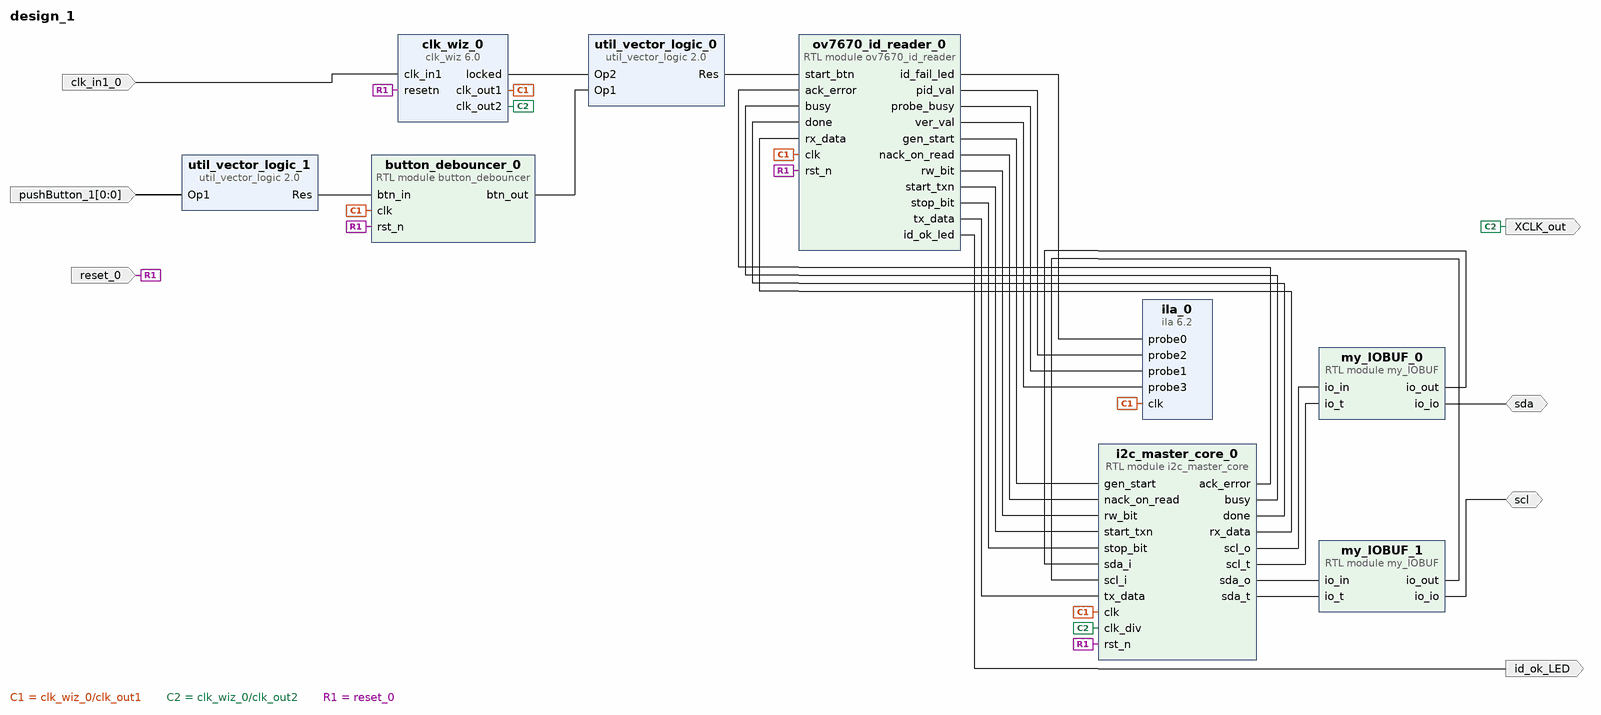
[diagram p0: block diagram of the top level]
# Vivado block design design_1, xc7z020clg400-2, Vivado 2022.2
create_bd_design design_1

create_bd_port -dir I -type rst reset_0
set_property -dict {CONFIG.POLARITY ACTIVE_LOW} [get_bd_ports reset_0]
create_bd_port -dir O -type clk XCLK_out
create_bd_port -dir IO sda
create_bd_port -dir IO scl
create_bd_port -dir I -from 0 -to 0 pushButton_1
create_bd_port -dir O id_ok_LED
create_bd_port -dir I -type clk clk_in1_0
set_property -dict {CONFIG.FREQ_HZ 50000000} [get_bd_ports clk_in1_0]

create_bd_cell -type ip -vlnv xilinx.com:ip:clk_wiz:6.0 clk_wiz_0
set_property -dict [list \
  CONFIG.CLKIN1_JITTER_PS 200.0 \
  CONFIG.CLKOUT1_JITTER 139.128 \
  CONFIG.CLKOUT1_PHASE_ERROR 154.678 \
  CONFIG.CLKOUT2_JITTER 202.151 \
  CONFIG.CLKOUT2_PHASE_ERROR 154.678 \
  CONFIG.CLKOUT2_REQUESTED_OUT_FREQ 24 \
  CONFIG.CLKOUT2_USED true \
  CONFIG.MMCM_CLKFBOUT_MULT_F 24.000 \
  CONFIG.MMCM_CLKIN1_PERIOD 20.000 \
  CONFIG.MMCM_CLKIN2_PERIOD 10.0 \
  CONFIG.MMCM_CLKOUT0_DIVIDE_F 12.000 \
  CONFIG.MMCM_CLKOUT1_DIVIDE 50 \
  CONFIG.NUM_OUT_CLKS 2 \
  CONFIG.PRIM_IN_FREQ 50.0 \
  CONFIG.RESET_PORT resetn \
  CONFIG.RESET_TYPE ACTIVE_LOW \
] [get_bd_cells clk_wiz_0]
create_bd_cell -type ip -vlnv xilinx.com:ip:util_vector_logic:2.0 util_vector_logic_0
create_bd_cell -type ip -vlnv xilinx.com:ip:util_vector_logic:2.0 util_vector_logic_1
set_property -dict {CONFIG.C_OPERATION not CONFIG.C_SIZE 1} [get_bd_cells util_vector_logic_1]
create_bd_cell -type ip -vlnv xilinx.com:ip:ila:6.2 ila_0
set_property -dict [list \
  CONFIG.C_DATA_DEPTH 65536 \
  CONFIG.C_MONITOR_TYPE Native \
  CONFIG.C_NUM_OF_PROBES 4 \
  CONFIG.C_PROBE0_TYPE 0 \
  CONFIG.C_PROBE2_WIDTH 8 \
  CONFIG.C_PROBE3_WIDTH 8 \
] [get_bd_cells ila_0]
create_bd_cell -type module -reference button_debouncer button_debouncer_0
create_bd_cell -type module -reference my_IOBUF my_IOBUF_0
create_bd_cell -type module -reference my_IOBUF my_IOBUF_1
create_bd_cell -type module -reference i2c_master_core i2c_master_core_0
create_bd_cell -type module -reference ov7670_id_reader ov7670_id_reader_0

# ---- connections ----

connect_bd_net [get_bd_ports sda] [get_bd_pins my_IOBUF_0/io_io]
connect_bd_net [get_bd_ports scl] [get_bd_pins my_IOBUF_1/io_io]
connect_bd_net -net Op1_0_1 [get_bd_ports pushButton_1] [get_bd_pins util_vector_logic_1/Op1]
connect_bd_net [get_bd_pins button_debouncer_0/btn_out] [get_bd_pins util_vector_logic_0/Op1]
connect_bd_net -net clk_in1_0_1 [get_bd_ports clk_in1_0] [get_bd_pins clk_wiz_0/clk_in1]
connect_bd_net [get_bd_pins clk_wiz_0/clk_out1] \
  [get_bd_pins button_debouncer_0/clk] [get_bd_pins ila_0/clk] [get_bd_pins i2c_master_core_0/clk] \
  [get_bd_pins ov7670_id_reader_0/clk]
connect_bd_net [get_bd_pins clk_wiz_0/clk_out2] [get_bd_ports XCLK_out] [get_bd_pins i2c_master_core_0/clk_div]
connect_bd_net [get_bd_pins clk_wiz_0/locked] [get_bd_pins util_vector_logic_0/Op2]
connect_bd_net [get_bd_pins i2c_master_core_0/ack_error] [get_bd_pins ov7670_id_reader_0/ack_error]
connect_bd_net [get_bd_pins i2c_master_core_0/busy] [get_bd_pins ov7670_id_reader_0/busy]
connect_bd_net [get_bd_pins i2c_master_core_0/done] [get_bd_pins ov7670_id_reader_0/done]
connect_bd_net [get_bd_pins i2c_master_core_0/rx_data] [get_bd_pins ov7670_id_reader_0/rx_data]
connect_bd_net [get_bd_pins i2c_master_core_0/scl_o] [get_bd_pins my_IOBUF_0/io_in]
connect_bd_net [get_bd_pins i2c_master_core_0/scl_t] [get_bd_pins my_IOBUF_0/io_t]
connect_bd_net [get_bd_pins i2c_master_core_0/sda_o] [get_bd_pins my_IOBUF_1/io_in]
connect_bd_net [get_bd_pins i2c_master_core_0/sda_t] [get_bd_pins my_IOBUF_1/io_t]
connect_bd_net [get_bd_pins my_IOBUF_0/io_out] [get_bd_pins i2c_master_core_0/sda_i]
connect_bd_net [get_bd_pins my_IOBUF_1/io_out] [get_bd_pins i2c_master_core_0/scl_i]
connect_bd_net [get_bd_pins ov7670_id_reader_0/gen_start] [get_bd_pins i2c_master_core_0/gen_start]
connect_bd_net [get_bd_pins ov7670_id_reader_0/id_fail_led] [get_bd_pins ila_0/probe0]
connect_bd_net [get_bd_pins ov7670_id_reader_0/id_ok_led] [get_bd_ports id_ok_LED]
connect_bd_net [get_bd_pins ov7670_id_reader_0/nack_on_read] [get_bd_pins i2c_master_core_0/nack_on_read]
connect_bd_net [get_bd_pins ov7670_id_reader_0/pid_val] [get_bd_pins ila_0/probe2]
connect_bd_net [get_bd_pins ov7670_id_reader_0/probe_busy] [get_bd_pins ila_0/probe1]
connect_bd_net [get_bd_pins ov7670_id_reader_0/rw_bit] [get_bd_pins i2c_master_core_0/rw_bit]
connect_bd_net [get_bd_pins ov7670_id_reader_0/start_txn] [get_bd_pins i2c_master_core_0/start_txn]
connect_bd_net [get_bd_pins ov7670_id_reader_0/stop_bit] [get_bd_pins i2c_master_core_0/stop_bit]
connect_bd_net [get_bd_pins ov7670_id_reader_0/tx_data] [get_bd_pins i2c_master_core_0/tx_data]
connect_bd_net [get_bd_pins ov7670_id_reader_0/ver_val] [get_bd_pins ila_0/probe3]
connect_bd_net -net reset_rtl_0_1 [get_bd_ports reset_0] \
  [get_bd_pins button_debouncer_0/rst_n] [get_bd_pins clk_wiz_0/resetn] [get_bd_pins i2c_master_core_0/rst_n] \
  [get_bd_pins ov7670_id_reader_0/rst_n]
connect_bd_net [get_bd_pins util_vector_logic_0/Res] [get_bd_pins ov7670_id_reader_0/start_btn]
connect_bd_net [get_bd_pins util_vector_logic_1/Res] [get_bd_pins button_debouncer_0/btn_in]

validate_bd_design
save_bd_design
